# Altium schematic sheet DXES101B-659637-DIGITAL-INPUTS.SchDoc
size A3; Organization: Altium Limited; Address1: 3 Minna Close; Address2: Belrose; Address3: NSW 2085; Address4: Australia; SheetNumber: 5; SheetTotal: 10
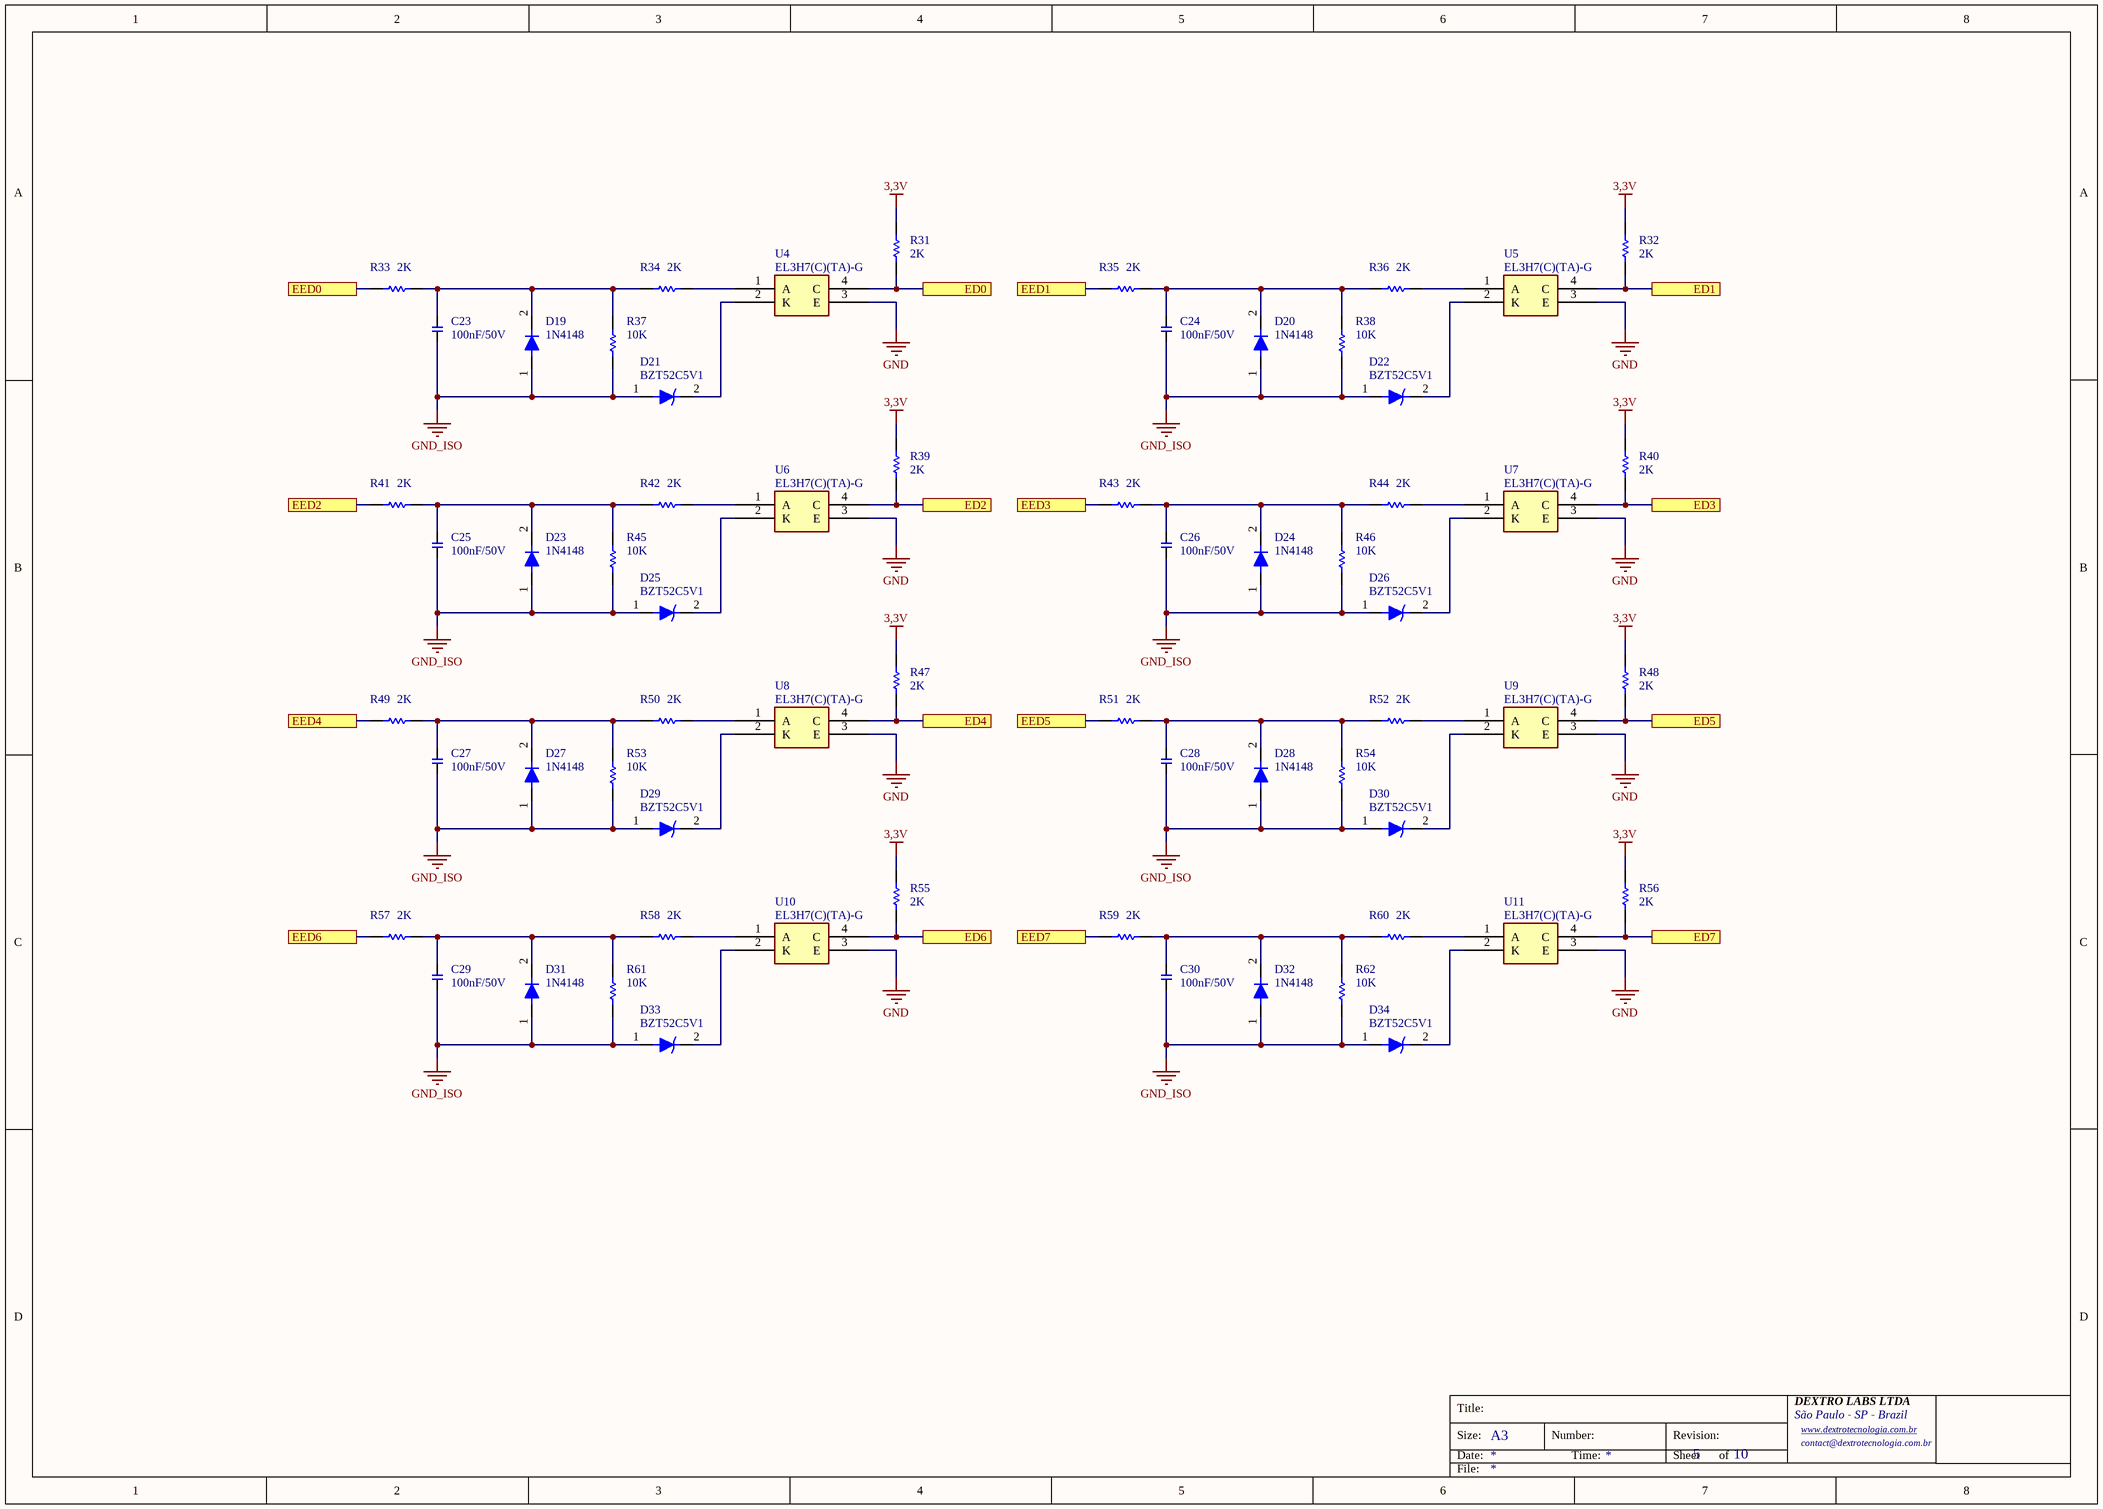
[diagram p0: DXES101B-659637-DIGITAL-INPUTS.SchDoc]

## Parts
C23  100nF/50V  [CAP-0603]
C24  100nF/50V  [CAP-0603]
C25  100nF/50V  [CAP-0603]
C26  100nF/50V  [CAP-0603]
C27  100nF/50V  [CAP-0603]
C28  100nF/50V  [CAP-0603]
C29  100nF/50V  [CAP-0603]
C30  100nF/50V  [CAP-0603]
D19  1N4148  [SOD123]
D20  1N4148  [SOD123]
D21  BZT52C5V1  [SOD123]
D22  BZT52C5V1  [SOD123]
D23  1N4148  [SOD123]
D24  1N4148  [SOD123]
D25  BZT52C5V1  [SOD123]
D26  BZT52C5V1  [SOD123]
D27  1N4148  [SOD123]
D28  1N4148  [SOD123]
D29  BZT52C5V1  [SOD123]
D30  BZT52C5V1  [SOD123]
D31  1N4148  [SOD123]
D32  1N4148  [SOD123]
D33  BZT52C5V1  [SOD123]
D34  BZT52C5V1  [SOD123]
R31  2K  [RES-0603]
R32  2K  [RES-0603]
R33  2K  [RES-1206]
R34  2K  [RES-1206]
R35  2K  [RES-1206]
R36  2K  [RES-1206]
R37  10K  [RES-0603]
R38  10K  [RES-0603]
R39  2K  [RES-0603]
R40  2K  [RES-0603]
R41  2K  [RES-1206]
R42  2K  [RES-1206]
R43  2K  [RES-1206]
R44  2K  [RES-1206]
R45  10K  [RES-0603]
R46  10K  [RES-0603]
R47  2K  [RES-0603]
R48  2K  [RES-0603]
R49  2K  [RES-1206]
R50  2K  [RES-1206]
R51  2K  [RES-1206]
R52  2K  [RES-1206]
R53  10K  [RES-0603]
R54  10K  [RES-0603]
R55  2K  [RES-0603]
R56  2K  [RES-0603]
R57  2K  [RES-1206]
R58  2K  [RES-1206]
R59  2K  [RES-1206]
R60  2K  [RES-1206]
R61  10K  [RES-0603]
R62  10K  [RES-0603]
U4  EL3H7(C)(TA)-G  [SSOP-4]
U5  EL3H7(C)(TA)-G  [SSOP-4]
U6  EL3H7(C)(TA)-G  [SSOP-4]
U7  EL3H7(C)(TA)-G  [SSOP-4]
U8  EL3H7(C)(TA)-G  [SSOP-4]
U9  EL3H7(C)(TA)-G  [SSOP-4]
U10  EL3H7(C)(TA)-G  [SSOP-4]
U11  EL3H7(C)(TA)-G  [SSOP-4]

## Ports
ED0 (see DXES101B-659637-GENERAL[3B], DXES101B-659637-POWER-AND-SIGNALS[2B]), ED1 (see DXES101B-659637-GENERAL[3B], DXES101B-659637-POWER-AND-SIGNALS[3B]), ED2 (see DXES101B-659637-GENERAL[3B], DXES101B-659637-POWER-AND-SIGNALS[2B]), ED3 (see DXES101B-659637-GENERAL[3B], DXES101B-659637-POWER-AND-SIGNALS[3B]), ED4 (see DXES101B-659637-GENERAL[3B], DXES101B-659637-POWER-AND-SIGNALS[2B]), ED5 (see DXES101B-659637-GENERAL[3B], DXES101B-659637-POWER-AND-SIGNALS[3B]), ED6 (see DXES101B-659637-GENERAL[3B], DXES101B-659637-POWER-AND-SIGNALS[2C]), ED7 (see DXES101B-659637-GENERAL[3B], DXES101B-659637-POWER-AND-SIGNALS[3C]), EED0 (see DXES101B-659637-GENERAL[4B]), EED1 (see DXES101B-659637-GENERAL[4B]), EED2 (see DXES101B-659637-GENERAL[4B]), EED3 (see DXES101B-659637-GENERAL[4B]), EED4 (see DXES101B-659637-GENERAL[4B]), EED5 (see DXES101B-659637-GENERAL[4B]), EED6 (see DXES101B-659637-GENERAL[4B]), EED7 (see DXES101B-659637-GENERAL[4B])

## Nets
3,3V: R31.2 R32.2 R39.2 R40.2 R47.2 R48.2 R55.2 R56.2
GND: U4.3(E) U5.3(E) U6.3(E) U7.3(E) U8.3(E) U9.3(E) U10.3(E) U11.3(E)
GND_ISO: C23.1 C24.1 C25.1 C26.1 C27.1 C28.1 C29.1 C30.1 D19.1(A1) D20.1(A1) D21.1(A1) D22.1(A1) D23.1(A1) D24.1(A1) D25.1(A1) D26.1(A1) D27.1(A1) D28.1(A1) D29.1(A1) D30.1(A1) D31.1(A1) D32.1(A1) D33.1(A1) D34.1(A1) R37.1 R38.1 R45.1 R46.1 R53.1 R54.1 R61.1 R62.1
ED0: R31.1 U4.4(C) ; port ED0
ED1: R32.1 U5.4(C) ; port ED1
ED2: R39.1 U6.4(C) ; port ED2
ED3: R40.1 U7.4(C) ; port ED3
ED4: R47.1 U8.4(C) ; port ED4
ED5: R48.1 U9.4(C) ; port ED5
ED6: R55.1 U10.4(C) ; port ED6
ED7: R56.1 U11.4(C) ; port ED7
EED0: R33.1 ; port EED0
EED1: R35.1 ; port EED1
EED2: R41.1 ; port EED2
EED3: R43.1 ; port EED3
EED4: R49.1 ; port EED4
EED5: R51.1 ; port EED5
EED6: R57.1 ; port EED6
EED7: R59.1 ; port EED7
NetC23_2: C23.2 D19.2(K) R33.2 R34.1 R37.2
NetC24_2: C24.2 D20.2(K) R35.2 R36.1 R38.2
NetC25_2: C25.2 D23.2(K) R41.2 R42.1 R45.2
NetC26_2: C26.2 D24.2(K) R43.2 R44.1 R46.2
NetC27_2: C27.2 D27.2(K) R49.2 R50.1 R53.2
NetC28_2: C28.2 D28.2(K) R51.2 R52.1 R54.2
NetC29_2: C29.2 D31.2(K) R57.2 R58.1 R61.2
NetC30_2: C30.2 D32.2(K) R59.2 R60.1 R62.2
NetD21_2: D21.2(K) U4.2(K)
NetD22_2: D22.2(K) U5.2(K)
NetD25_2: D25.2(K) U6.2(K)
NetD26_2: D26.2(K) U7.2(K)
NetD29_2: D29.2(K) U8.2(K)
NetD30_2: D30.2(K) U9.2(K)
NetD33_2: D33.2(K) U10.2(K)
NetD34_2: D34.2(K) U11.2(K)
NetR34_2: R34.2 U4.1(A)
NetR36_2: R36.2 U5.1(A)
NetR42_2: R42.2 U6.1(A)
NetR44_2: R44.2 U7.1(A)
NetR50_2: R50.2 U8.1(A)
NetR52_2: R52.2 U9.1(A)
NetR58_2: R58.2 U10.1(A)
NetR60_2: R60.2 U11.1(A)

## Notes on the sheet
- Title:
- Size:
- Date:
- A3
- Number:
- Time:
- Revision:
- Sheet
- of
- DEXTRO LABS LTDA
- São Paulo - SP - Brazil
- www.dextrotecnologia.com.br <http://www.dextrotecnologia.com.br>
- contact@dextrotecnologia.com.br
- File:

## Library data of the parts
C23-C30 = CAP-100nF/50V-0603-X7R-MLCC: 50V 100nF X7R ±10% 0603 Multilayer Ceramic Capacitors MLCC - SMD/SMT ROHS; LCSC: C14663
D19 D20 D23 D24 D27 D28 D31 D32 = 1N4148: 1A 4ns 75V Independent 1V@50mA 150mA SOD-123 Single Diodes RoHS
D21 D22 D25 D26 D29 D30 D33 D34 = BZT52C5V1: DIODE-ZENER-5V1-500mV
R31 R32 R39 R40 R47 R48 R55 R56 = RES-2K-1%-100mW-0603: 100mW Thick Film Resistor 75V ±100ppm/℃ ±2% 1kΩ 0603 Chip Resistor - Surface Mount ROHS; LCSC: C22975
R33-R36 R41-R44 R49-R52 R57-R60 = RES-2K-1%-250mW-1206: 250mW Thick Film Resistor 200V ±100ppm/℃ ±5% 2kΩ 1206 Chip Resistor - Surface Mount ROHS; LCSC: C2907466
R37 R38 R45 R46 R53 R54 R61 R62 = RES-10K-1%-100mW-0603: 100mW Thick Film Resistor 75V ±100ppm/℃ ±1% 10kΩ 0603 Chip Resistor - Surface Mount ROHS; LCSC: C98220
U4-U11 = EL3H7(C)(TA)-G: 80V 3.75kV 50mA 200mV@10mA,1mA 6V 1.2V DC SSOP-4-1.27mm Transistor, Photovoltaic Output Optoisolators ROHS; LCSC: C92243